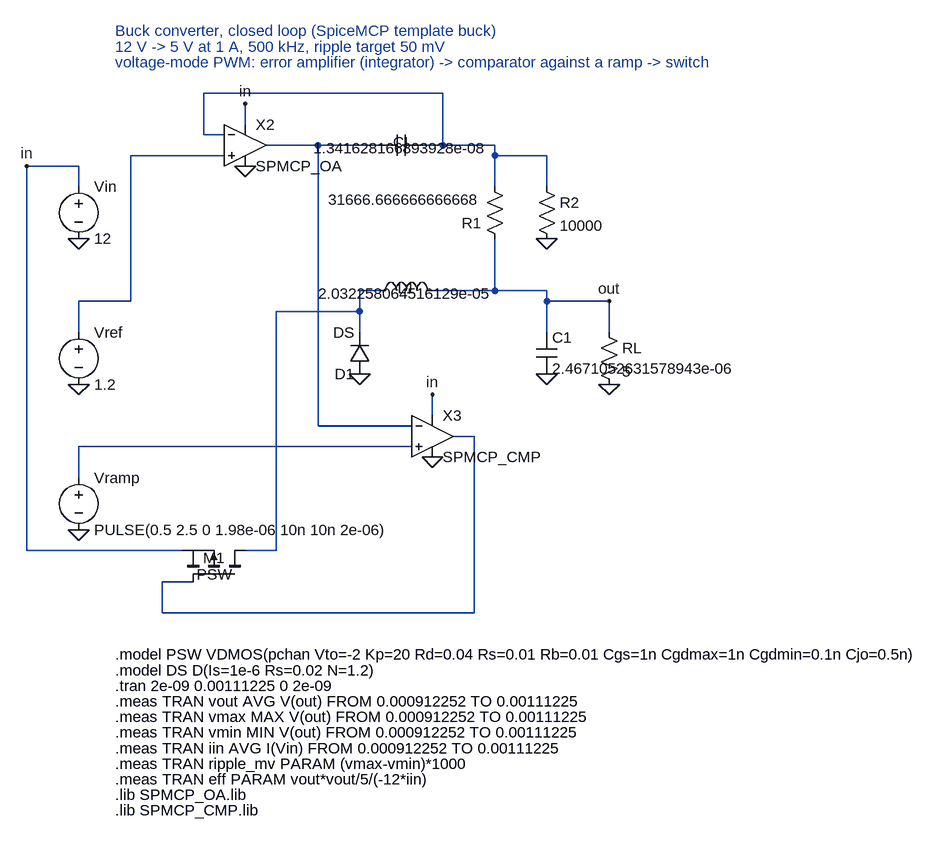
[diagram p0: schematic buck.asc]
buck.asc, the LTspice schematic file:
Version 4.1
SHEET 1 1600 1200
WIRE 576 144 576 224
WIRE 576 224 480 224
WIRE 656 288 656 240
WIRE 656 240 656 224
WIRE 656 224 576 224
WIRE 752 288 752 240
WIRE 752 240 656 240
WIRE 160 16 16 16
WIRE 16 16 16 240
WIRE 16 240 -64 240
WIRE -64 240 -64 288
WIRE 448 464 -64 464
WIRE -64 464 -64 512
WIRE 464 0 496 0
WIRE 496 0 496 -80
WIRE 496 -80 128 -80
WIRE 128 -80 128 -16
WIRE 128 -16 160 -16
WIRE 576 64 576 16
WIRE 576 16 576 0
WIRE 576 0 496 0
WIRE 656 64 656 16
WIRE 656 16 576 16
WIRE 368 288 368 256
WIRE 368 256 240 256
WIRE 240 256 240 624
WIRE 240 624 192 624
WIRE 400 224 368 224
WIRE 368 224 368 256
WIRE 512 448 544 448
WIRE 544 448 544 720
WIRE 544 720 64 720
WIRE 64 720 64 672
WIRE 64 672 112 672
WIRE 400 0 304 0
WIRE 304 0 224 0
WIRE 448 432 304 432
WIRE 304 432 304 0
WIRE 96 624 -144 624
WIRE -144 624 -144 32
WIRE -144 32 -64 32
WIRE -64 32 -64 64
WIRE 192 -32 192 -64
WIRE 480 416 480 384
FLAG 752 240 out
FLAG -144 32 in
FLAG 192 -64 in
FLAG 480 384 in
FLAG -64 144 0
FLAG -64 368 0
FLAG -64 592 0
FLAG 192 32 0
FLAG 656 144 0
FLAG 480 480 0
FLAG 368 352 0
FLAG 656 352 0
FLAG 752 368 0
SYMBOL OpAmps\\opamp2 192 -64 R0
SYMATTR InstName X2
SYMATTR Value SPMCP_OA
SYMBOL OpAmps\\opamp2 480 384 R0
SYMATTR InstName X3
SYMATTR Value SPMCP_CMP
SYMBOL cap 400 16 R270
WINDOW 0 36 32 VBottom 2
WINDOW 3 -4 32 VTop 2
SYMATTR InstName CI
SYMATTR Value 1.341628166893928e-08
SYMBOL ind 384 240 R270
WINDOW 0 36 56 VBottom 2
WINDOW 3 -4 56 VTop 2
SYMATTR InstName L1
SYMATTR Value 2.032258064516129e-05
SYMBOL pmos 192 672 M270
WINDOW 0 52 48 VBottom 2
WINDOW 3 -4 48 VTop 2
SYMATTR InstName M1
SYMATTR Value PSW
SYMBOL res 592 160 R180
SYMATTR InstName R1
SYMATTR Value 31666.666666666668
SYMBOL cap 640 288 R0
SYMATTR InstName C1
SYMATTR Value 2.4671052631578943e-06
SYMBOL diode 384 352 R180
SYMATTR InstName D1
SYMATTR Value DS
SYMBOL res 640 48 R0
SYMATTR InstName R2
SYMATTR Value 10000
SYMBOL res 736 272 R0
SYMATTR InstName RL
SYMATTR Value 5
SYMBOL voltage -64 48 R0
SYMATTR InstName Vin
SYMATTR Value 12
SYMBOL voltage -64 496 R0
SYMATTR InstName Vramp
SYMATTR Value PULSE(0.5 2.5 0 1.98e-06 10n 10n 2e-06)
SYMBOL voltage -64 272 R0
SYMATTR InstName Vref
SYMATTR Value 1.2
TEXT -8 -176 Left 2 ;Buck converter, closed loop (SpiceMCP template buck)
TEXT -8 -152 Left 2 ;12 V -> 5 V at 1 A, 500 kHz, ripple target 50 mV
TEXT -8 -128 Left 2 ;voltage-mode PWM: error amplifier (integrator) -> comparator against a ramp -> switch
TEXT -8 784 Left 2 !.model PSW VDMOS(pchan Vto=-2 Kp=20 Rd=0.04 Rs=0.01 Rb=0.01 Cgs=1n Cgdmax=1n Cgdmin=0.1n Cjo=0.5n)
TEXT -8 808 Left 2 !.model DS D(Is=1e-6 Rs=0.02 N=1.2)
TEXT -8 832 Left 2 !.tran 2e-09 0.00111225 0 2e-09
TEXT -8 856 Left 2 !.meas TRAN vout AVG V(out) FROM 0.000912252 TO 0.00111225
TEXT -8 880 Left 2 !.meas TRAN vmax MAX V(out) FROM 0.000912252 TO 0.00111225
TEXT -8 904 Left 2 !.meas TRAN vmin MIN V(out) FROM 0.000912252 TO 0.00111225
TEXT -8 928 Left 2 !.meas TRAN iin AVG I(Vin) FROM 0.000912252 TO 0.00111225
TEXT -8 952 Left 2 !.meas TRAN ripple_mv PARAM (vmax-vmin)*1000
TEXT -8 976 Left 2 !.meas TRAN eff PARAM vout*vout/5/(-12*iin)
TEXT -8 1000 Left 2 !.lib SPMCP_OA.lib
TEXT -8 1024 Left 2 !.lib SPMCP_CMP.lib

The netlist it stands for:
* buck.asc
X§X2 N001 N003 in 0 N006 SPMCP_OA  ; pins In+ In- V+ V- OUT
X§X3 N002 N006 in 0 N005 SPMCP_CMP  ; pins In+ In- V+ V- OUT
CI N006 N003 1.341628166893928e-08
L1 N004 out 2.032258064516129e-05
M1 N004 N005 in in PSW
R1 out N003 31666.666666666668
C1 out 0 2.4671052631578943e-06
D1 0 N004 DS
R2 N003 0 10000
RL out 0 5
Vin in 0 12
Vramp N002 0 PULSE(0.5 2.5 0 1.98e-06 10n 10n 2e-06)
Vref N001 0 1.2
.model D D
.lib standard.dio
.model NMOS NMOS
.model PMOS PMOS
.lib standard.mos
* Buck converter, closed loop (SpiceMCP template buck)
* 12 V -> 5 V at 1 A, 500 kHz, ripple target 50 mV
* voltage-mode PWM: error amplifier (integrator) -> comparator against a ramp -> switch
.model PSW VDMOS(pchan Vto=-2 Kp=20 Rd=0.04 Rs=0.01 Rb=0.01 Cgs=1n Cgdmax=1n Cgdmin=0.1n Cjo=0.5n)
.model DS D(Is=1e-6 Rs=0.02 N=1.2)
.tran 2e-09 0.00111225 0 2e-09
.meas TRAN vout AVG V(out) FROM 0.000912252 TO 0.00111225
.meas TRAN vmax MAX V(out) FROM 0.000912252 TO 0.00111225
.meas TRAN vmin MIN V(out) FROM 0.000912252 TO 0.00111225
.meas TRAN iin AVG I(Vin) FROM 0.000912252 TO 0.00111225
.meas TRAN ripple_mv PARAM (vmax-vmin)*1000
.meas TRAN eff PARAM vout*vout/5/(-12*iin)
.lib SPMCP_OA.lib
.lib SPMCP_CMP.lib
.backanno
.end